# EasyEDA Pro project ProPrj_STM32_无人机_2026-08-31.epro, schematic 遥控

## Sheets
1 MCU: Assembly Variant: Basic; Board Name: Board1; Create Date: 2026-08-23; Page Name: P1; Project Name: STM32_无人机; Schematic Name: Schematic1; Update Date: 2026-08-23; Company: 嘉立创EDA; Page Size: A4; Version: V1.0
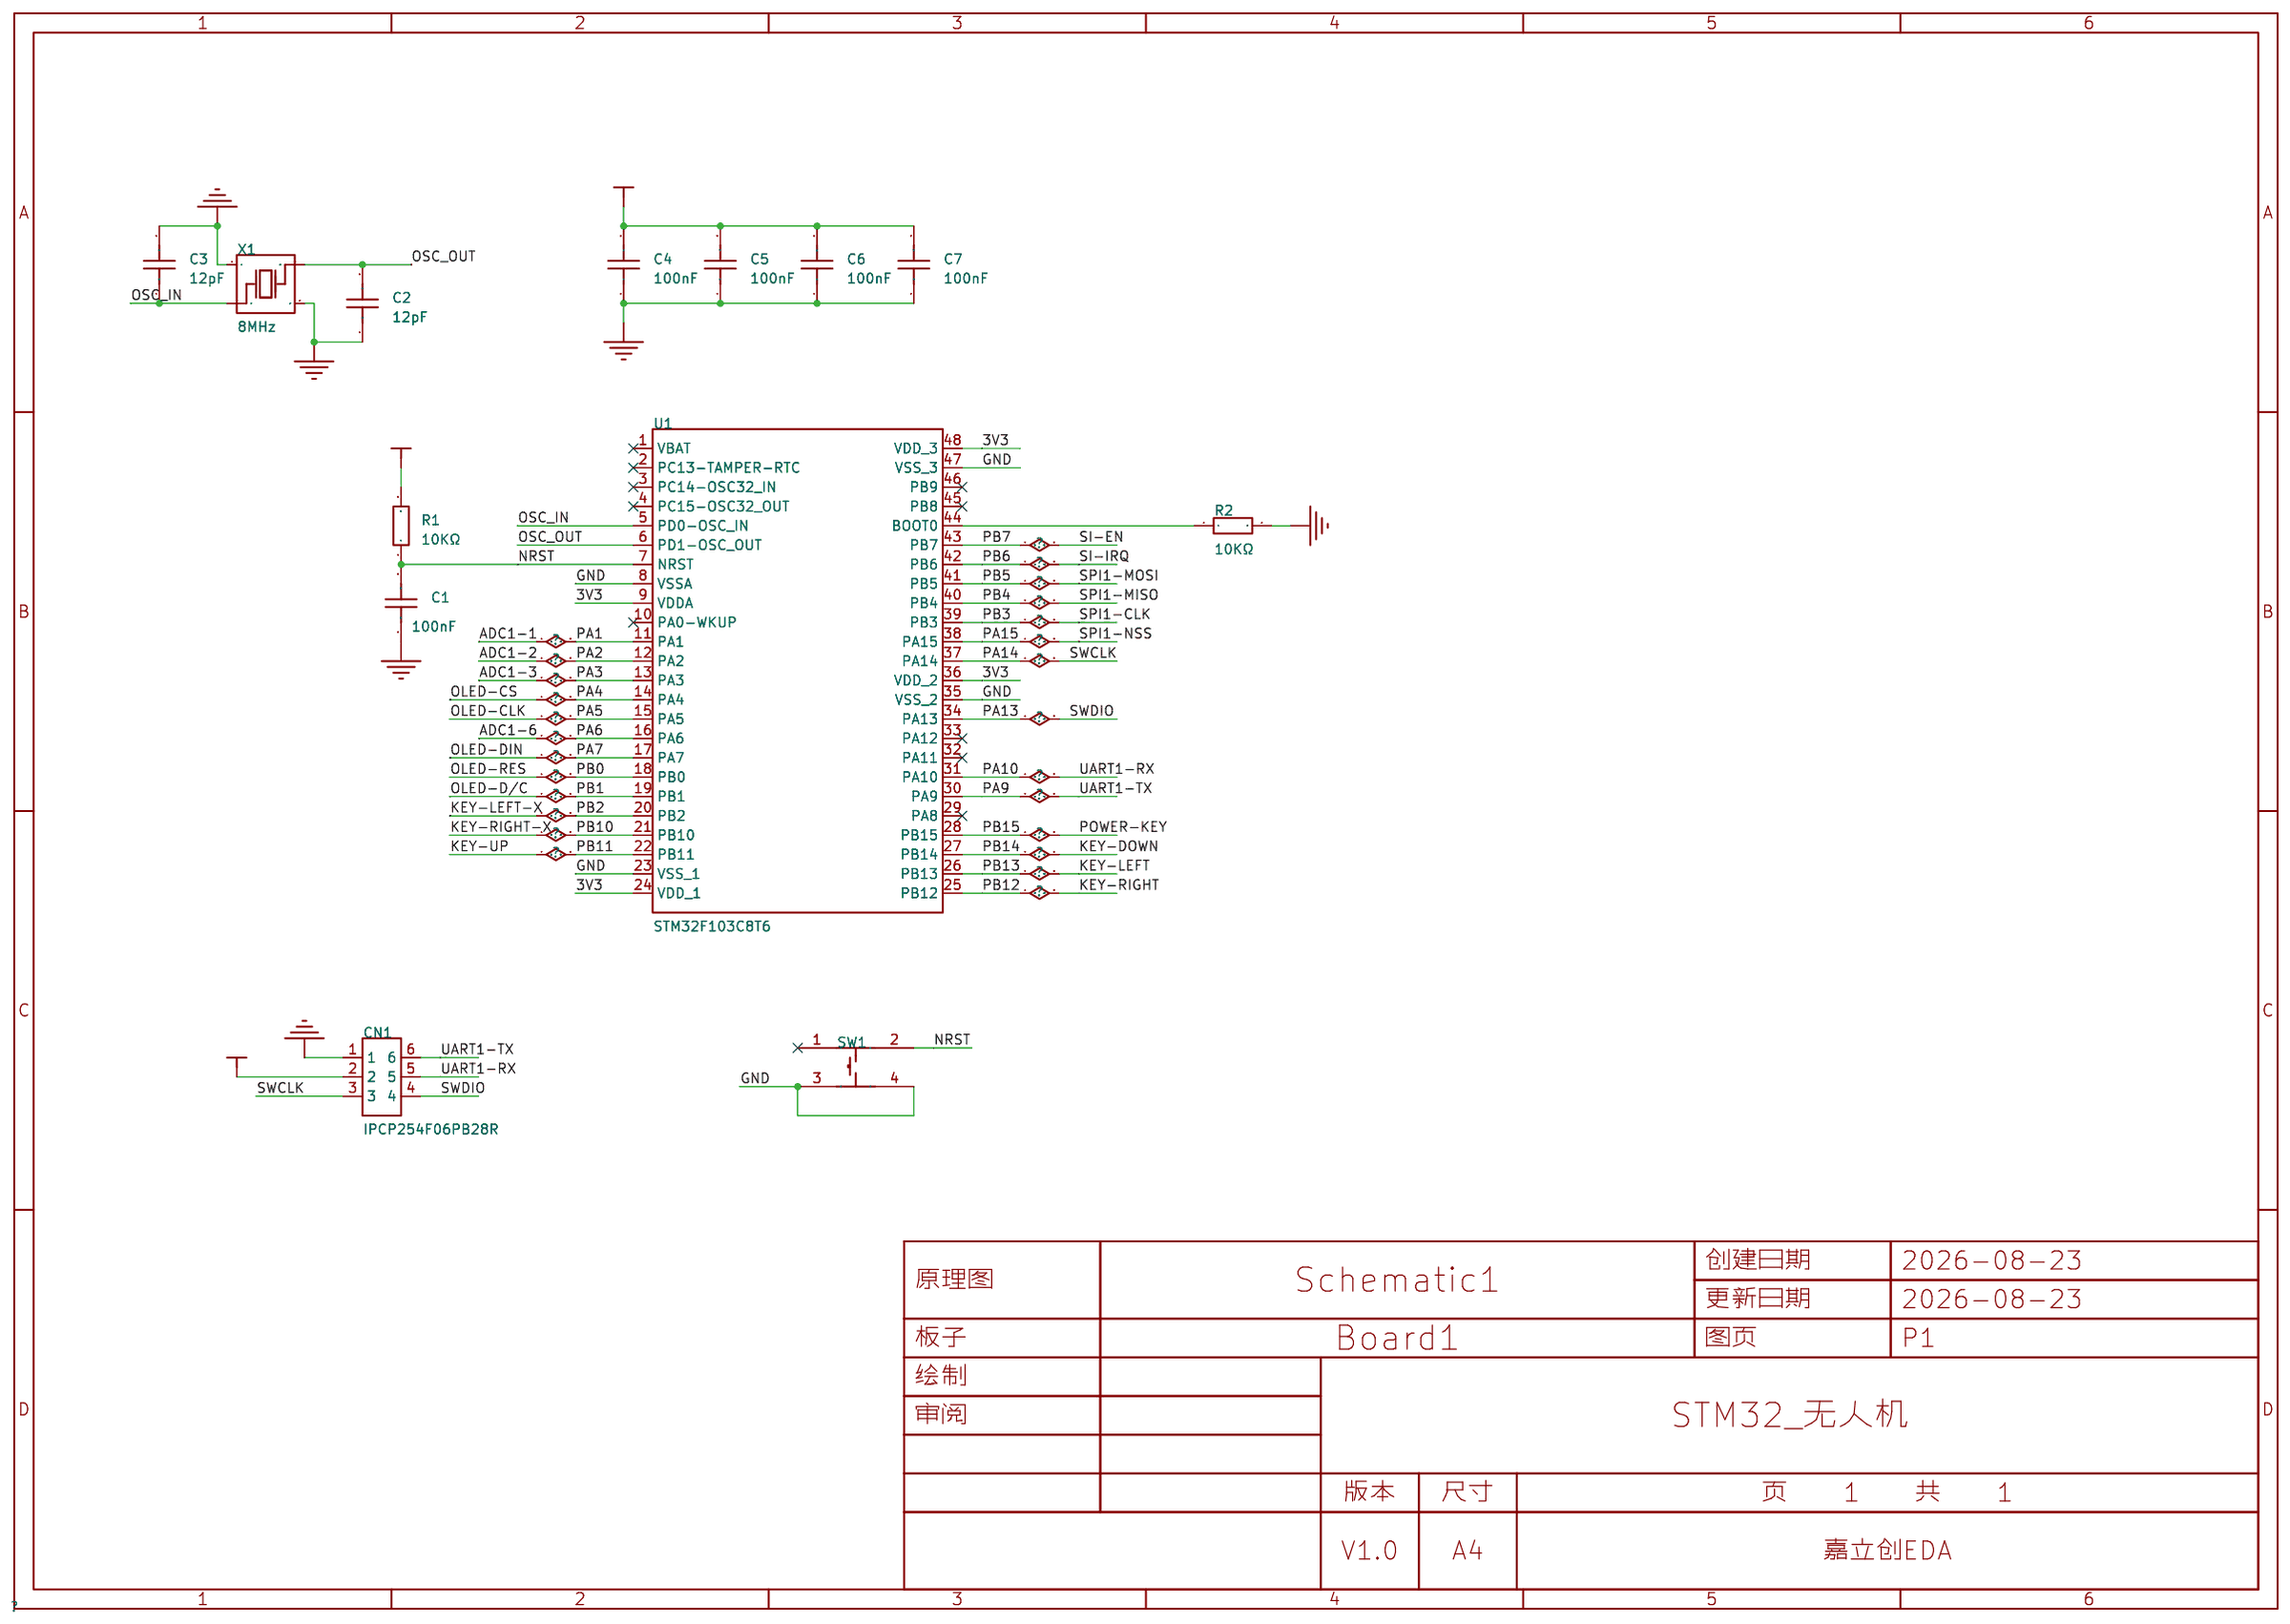
[diagram p0: MCU]
2 SI24R1: Board Name: 遥控器; Schematic Name: 遥控
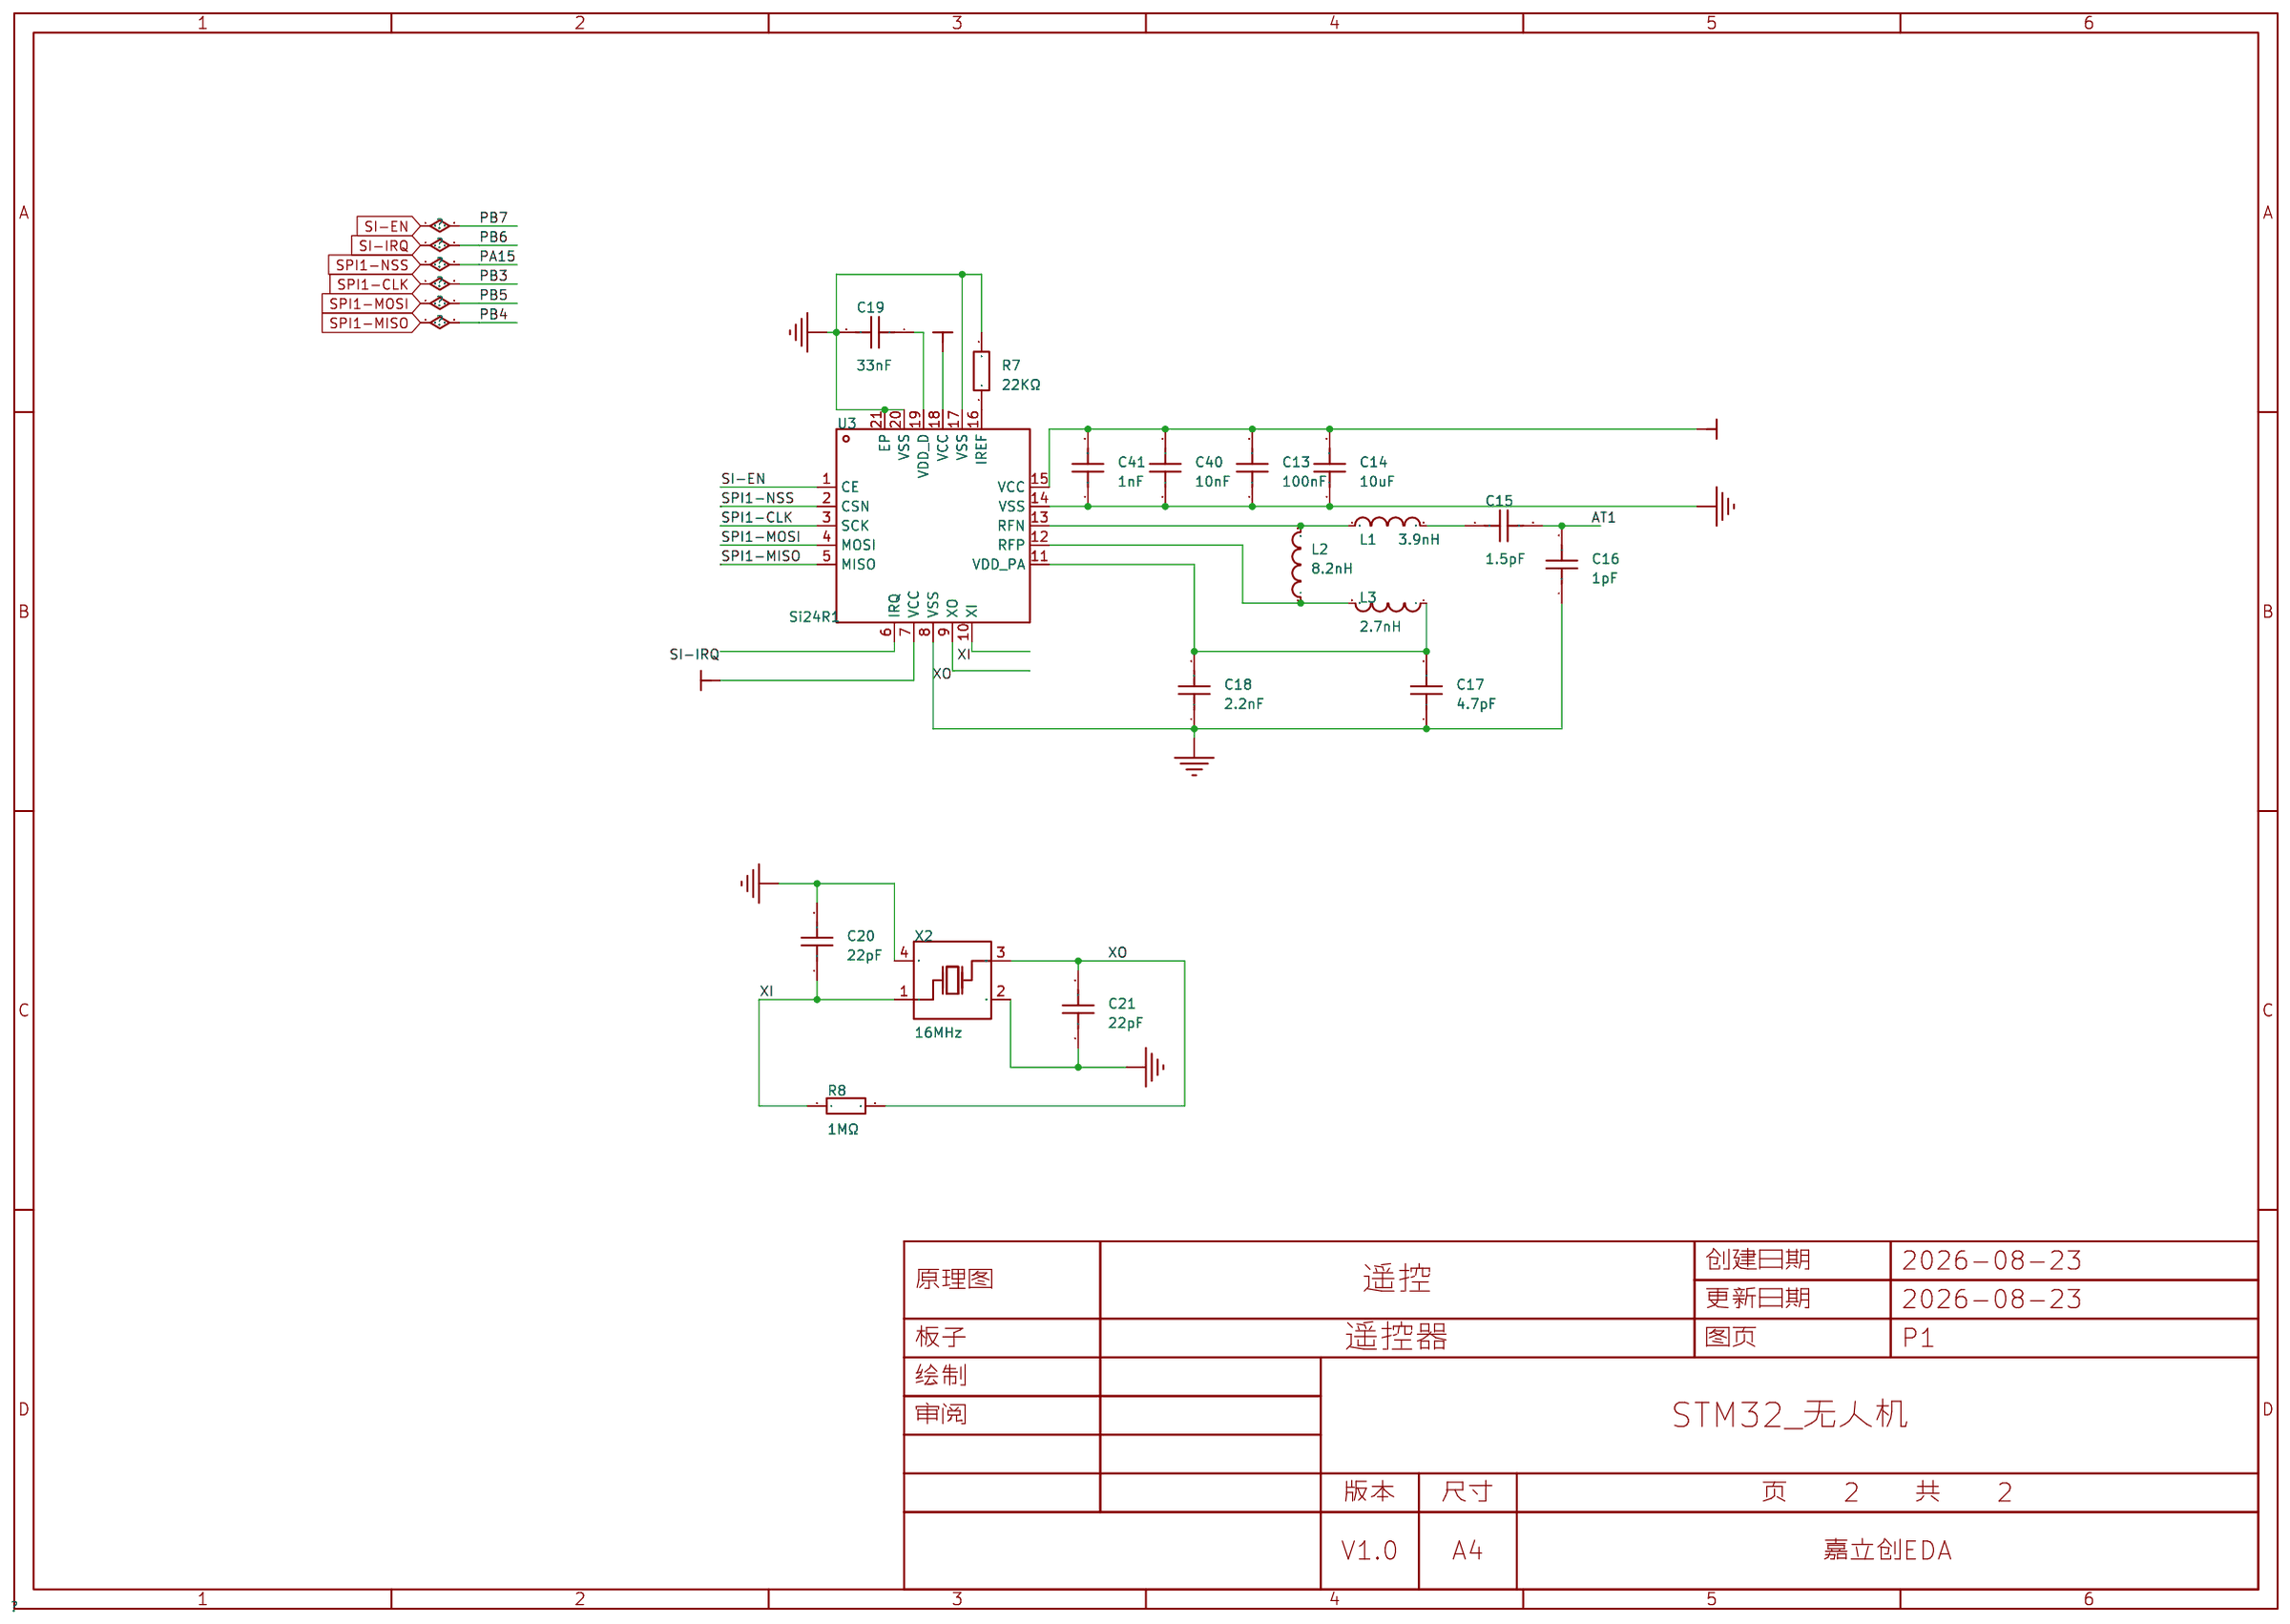
[diagram p1: SI24R1]
3 电源管理: Board Name: 遥控器; Schematic Name: 遥控
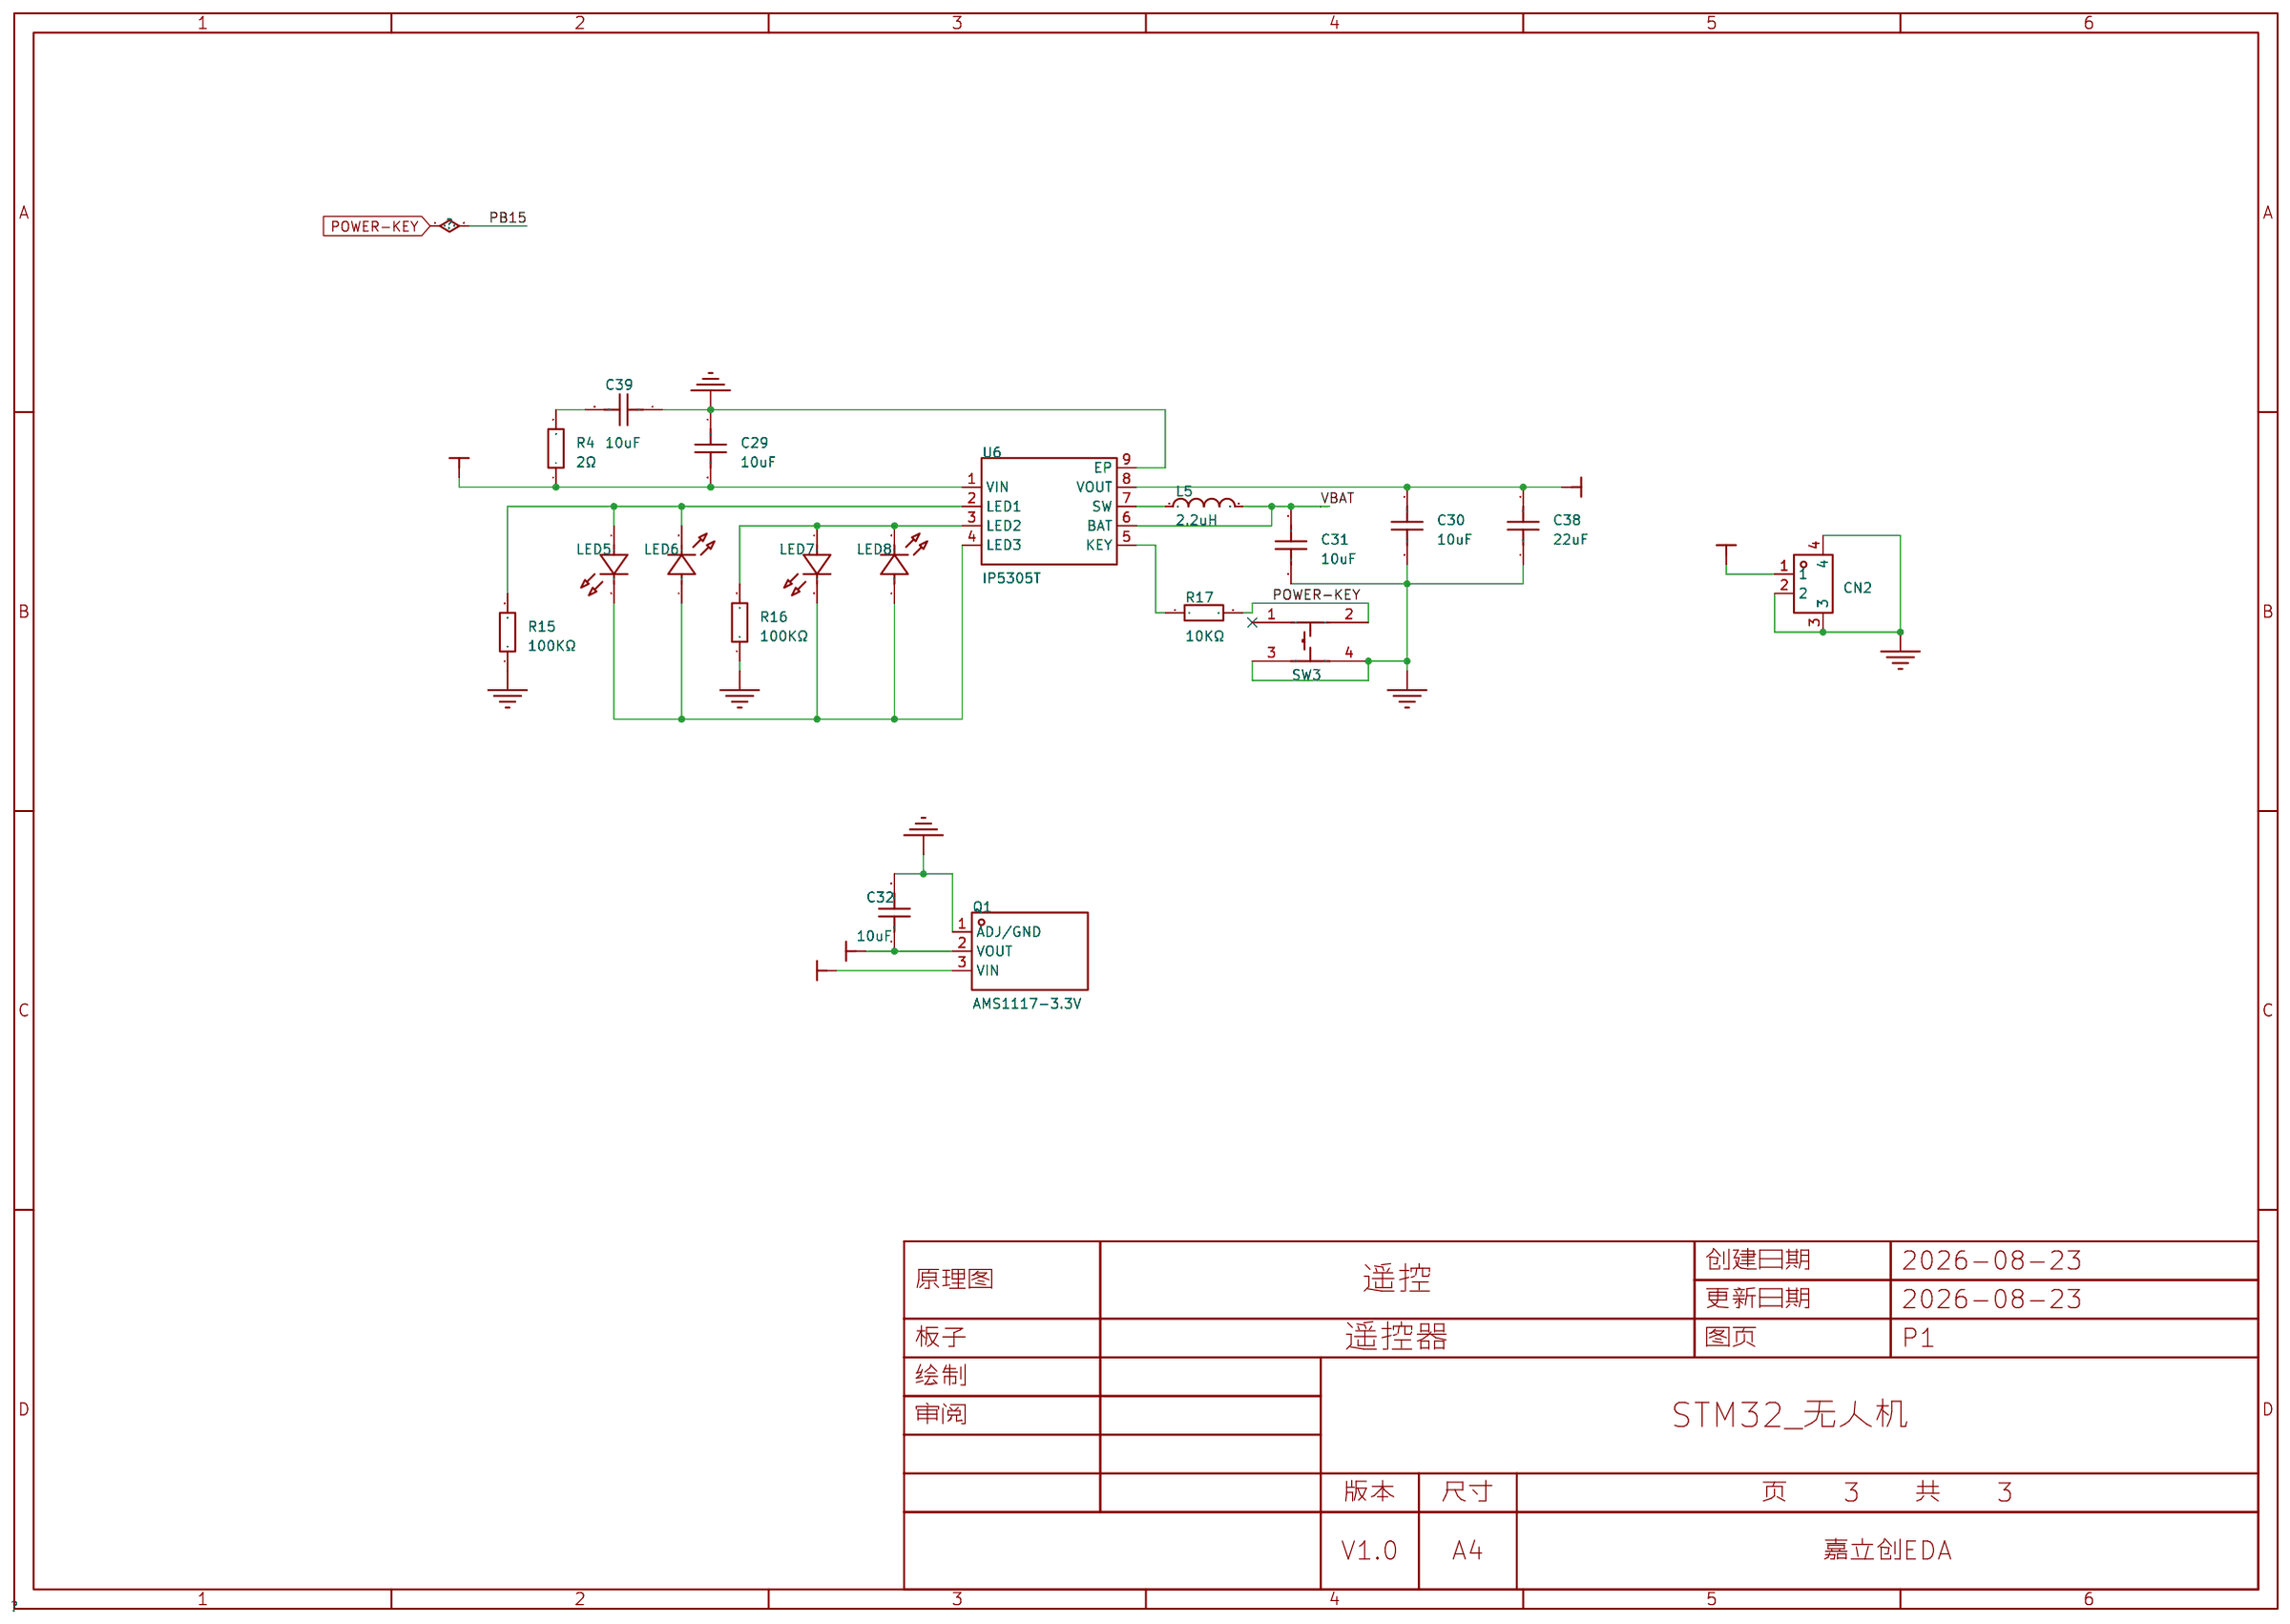
[diagram p2: 电源管理]
4 OLED: Board Name: 遥控器; Schematic Name: 遥控
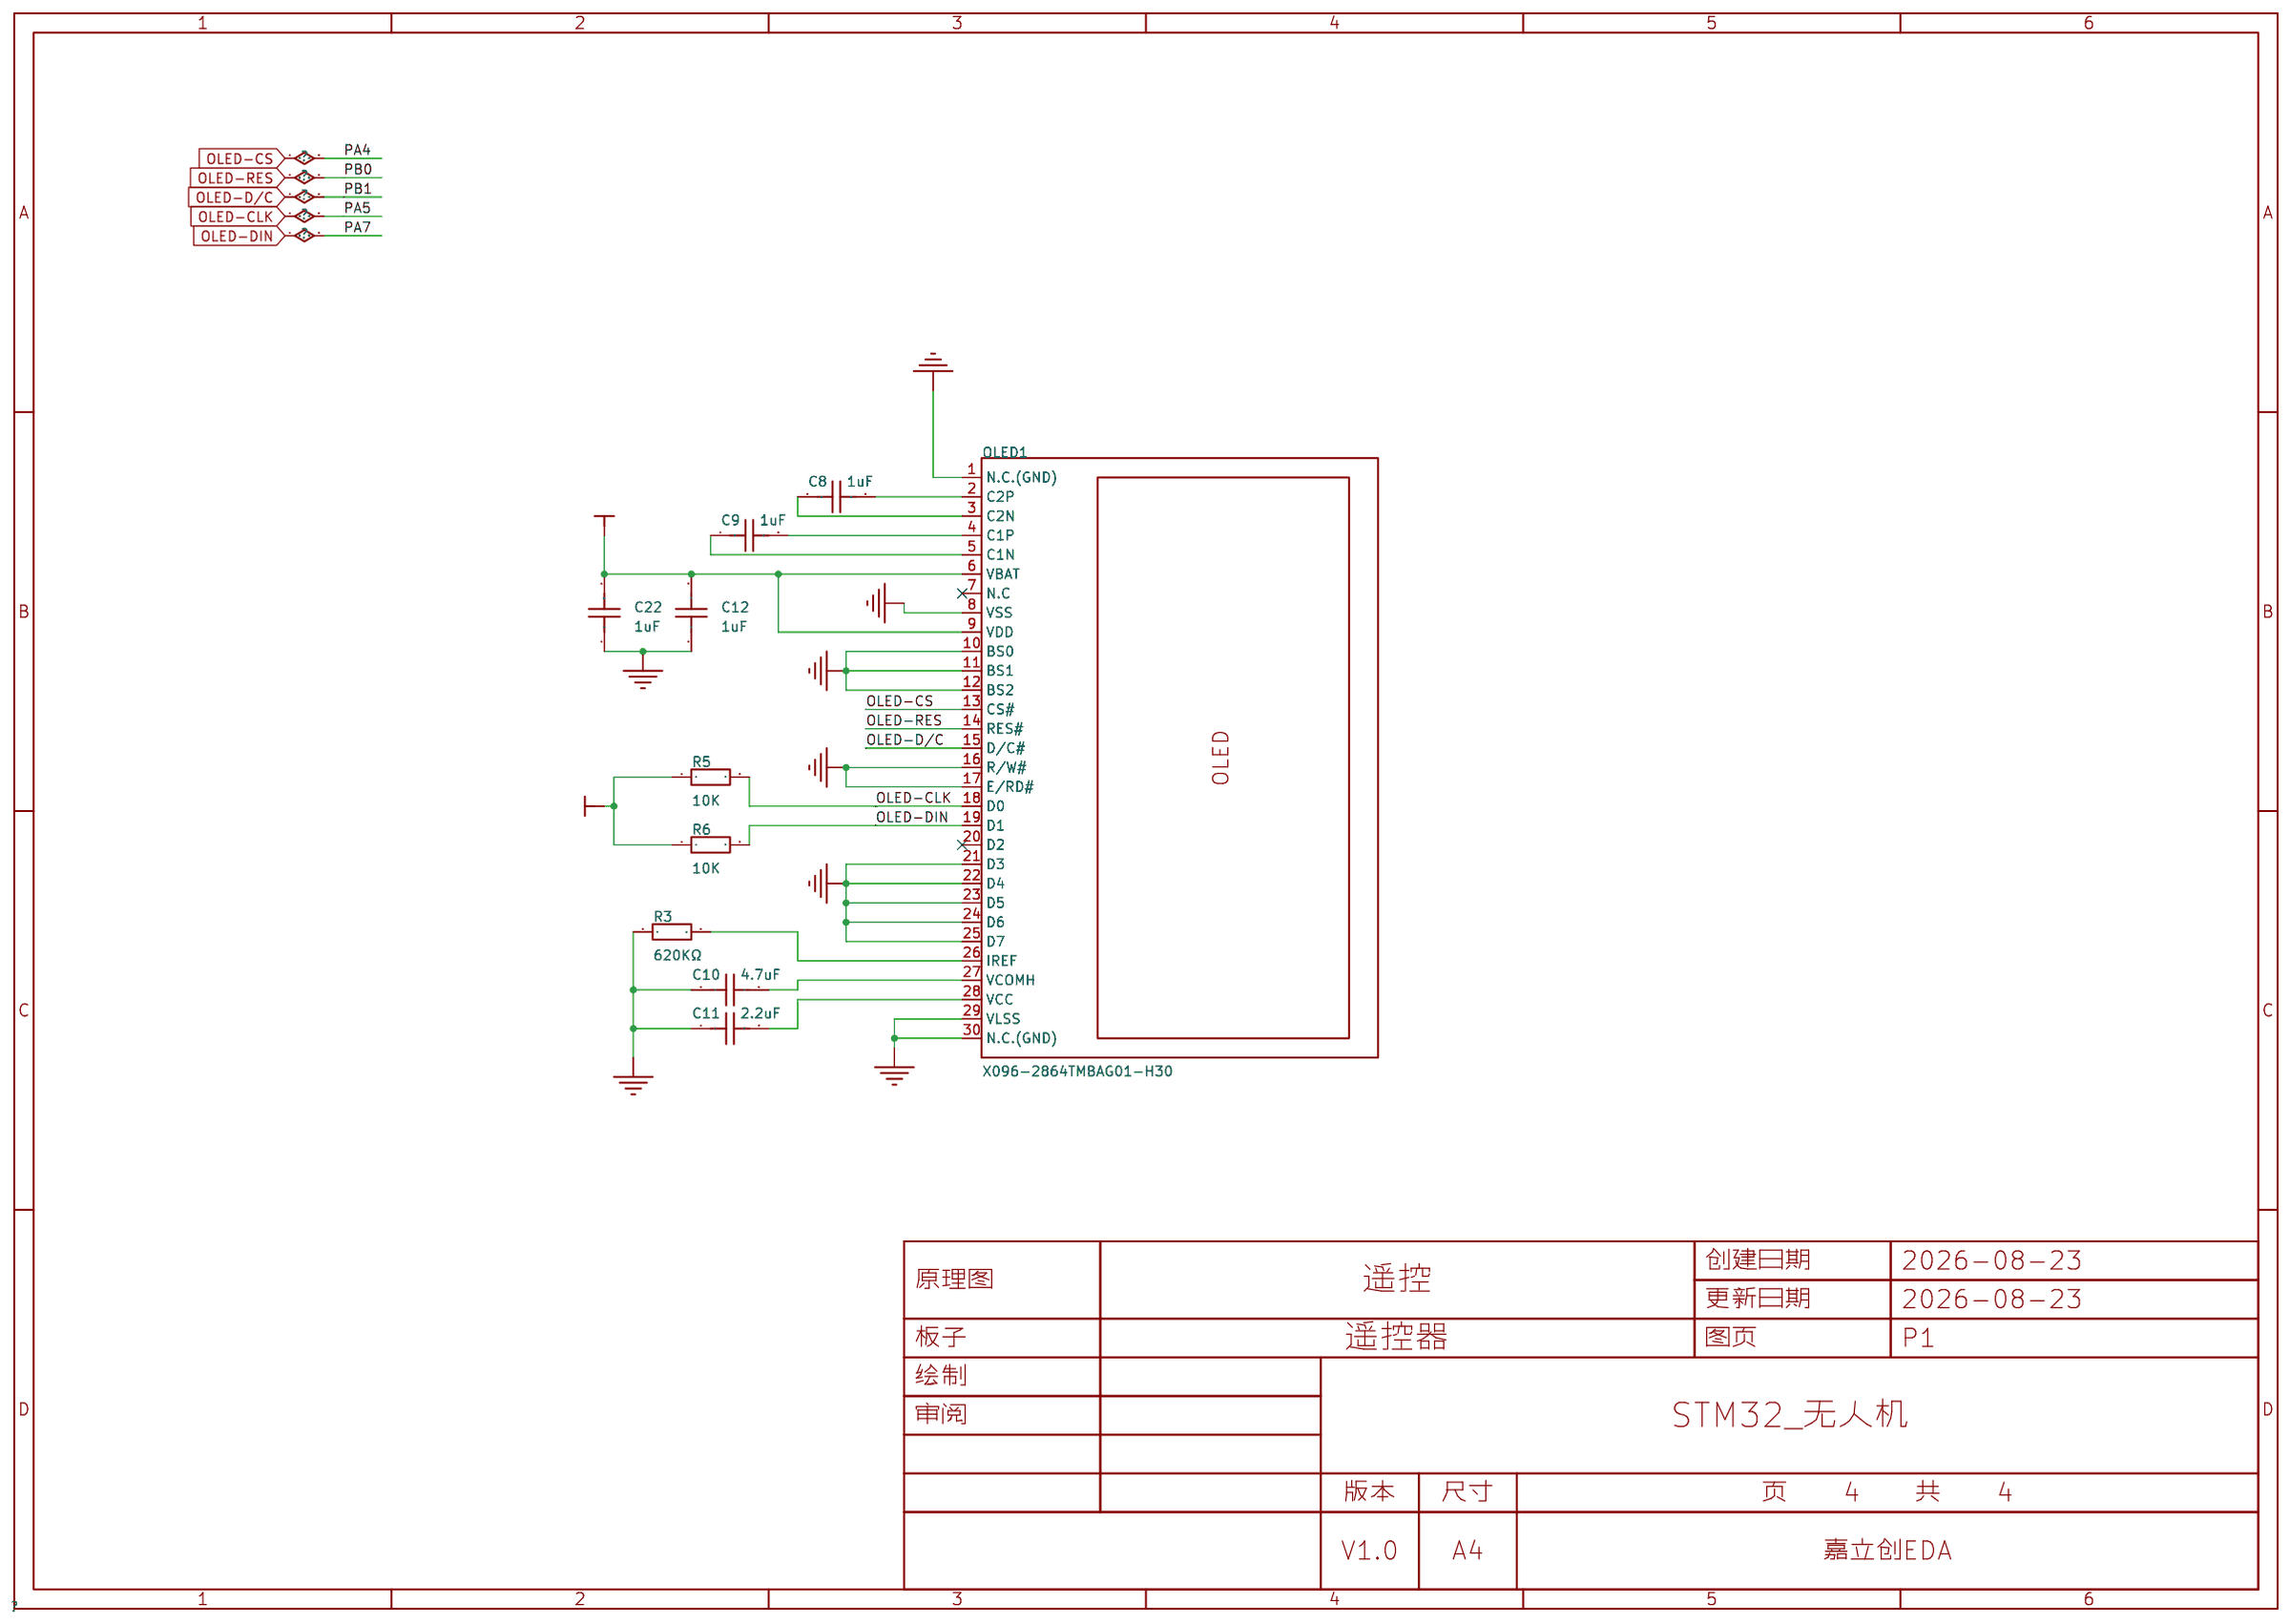
[diagram p3: OLED]
5 遥感和按键: Board Name: 遥控器; Create Date: 2026-08-24; Schematic Name: 遥控; Update Date: 2026-08-24
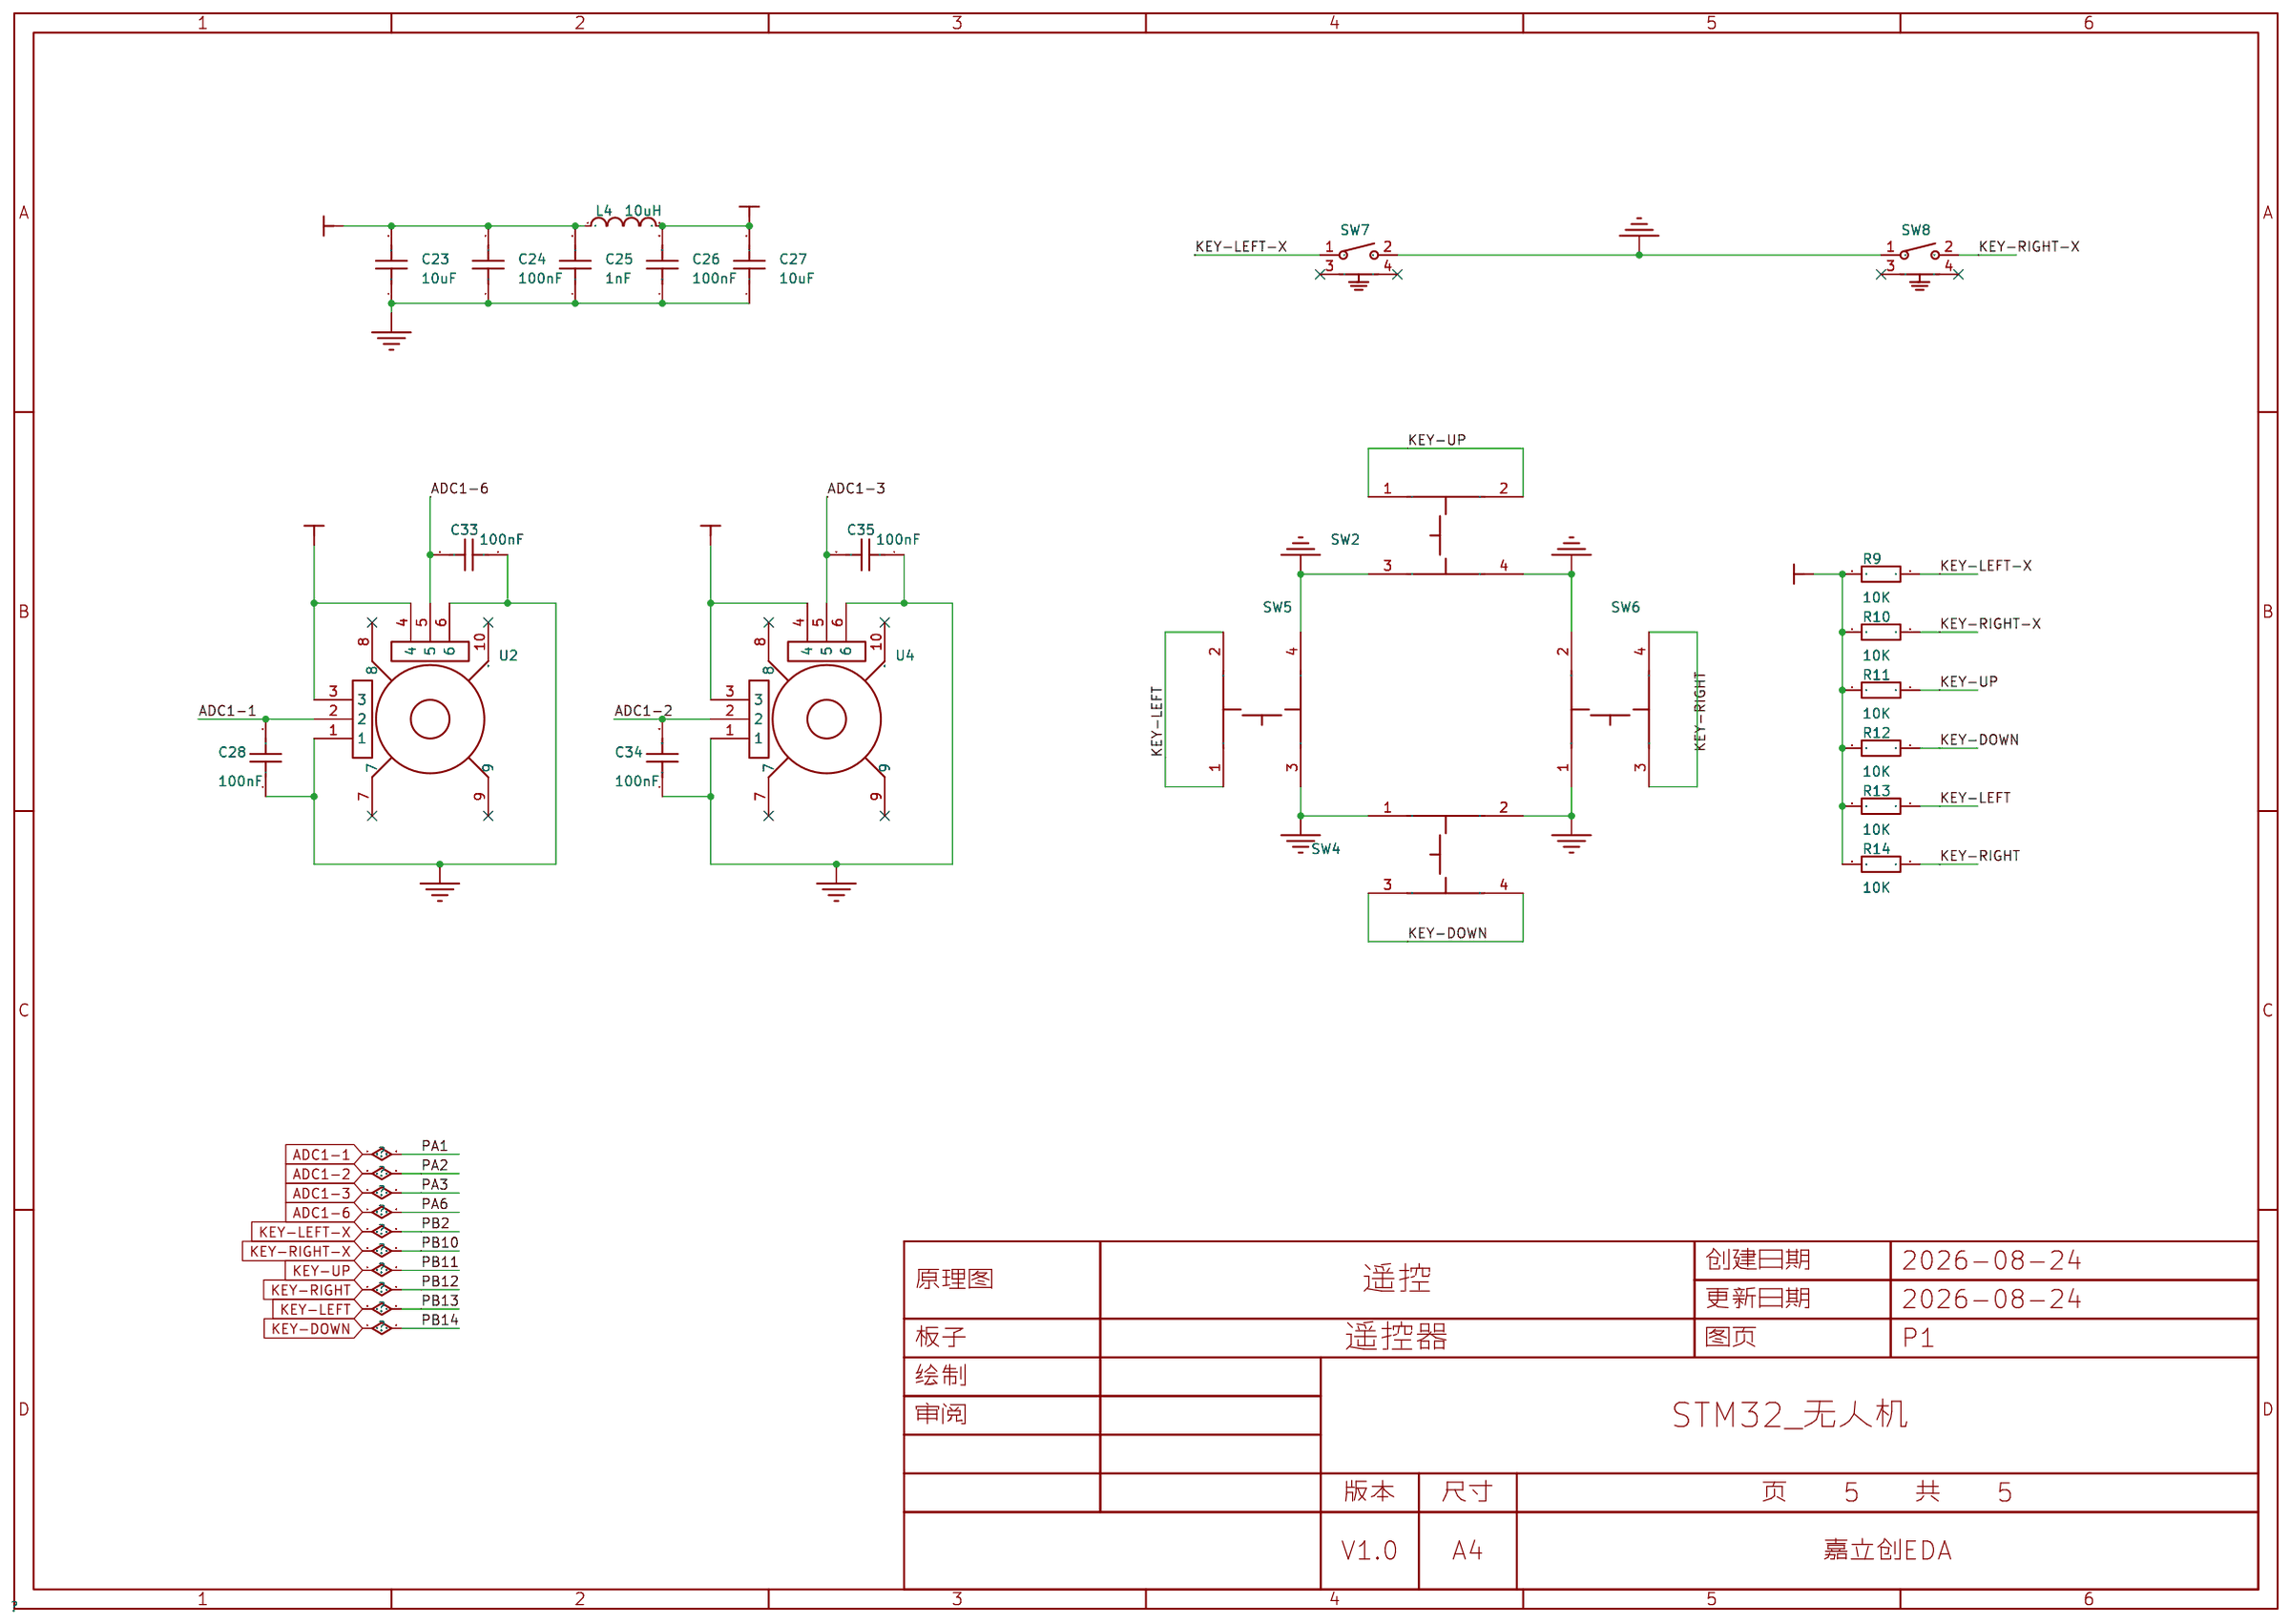
[diagram p4: 遥感和按键]

## Parts
sheet MCU
C1  100nF  [C0603]
C2  12pF  [C0603]
C3  12pF  [C0603]
C4  100nF  [C0603]
C5  100nF  [C0603]
C6  100nF  [C0603]
C7  100nF  [C0603]
CN1  IPCP254F06PB28R  [HDR-TH_6P-P2.54-H-F-R2-C3-S2.54-1]
R1  10KΩ  [R0603]
R2  10KΩ  [R0603]
SW1  SKRPACE010  [KEY-SMD_4P-L4.2-W3.2-P2.20-LS4.6]
U1  STM32F103C8T6  [LQFP-48_L7.0-W7.0-P0.50-LS9.0-BL]
X1  8MHz  [CRYSTAL-SMD_4P-L3.2-W2.5-BL]
sheet OLED
C8  1uF  [C0603]
C9  1uF  [C0603]
C10  4.7uF  [C0603]
C11  2.2uF  [C0603]
C12  1uF  [C0603]
C22  1uF  [C0603]
OLED1  X096-2864TMBAG01-H30  [OLED-SMD_X096-2864TMBAG01-H30]
R3  620KΩ  [R0603]
R5  10K  [R0603]
R6  10K  [R0603]
sheet SI24R1
C13  100nF  [C0603]
C14  10uF  [C0603]
C15  1.5pF  [C0603]
C16  1pF  [C0603]
C17  4.7pF  [C0603]
C18  2.2nF  [C0603]
C19  33nF  [C0603]
C20  22pF  [C0603]
C21  22pF  [C0603]
C40  10nF  [C0603]
C41  1nF  [C0603]
L1  3.9nH  [L0603]
L2  8.2nH  [L0603]
L3  2.7nH  [L0603]
R7  22KΩ  [R0603]
R8  1MΩ  [R0603]
U3  Si24R1  [QFN-20_L4.0-W4.0-P0.50-BL-EP]
X2  16MHz  [CRYSTAL-SMD_4P-L2.5-W2.0-BL-2]
sheet 电源管理
C29  10uF  [C0603]
C30  10uF  [C0603]
C31  10uF  [C0603]
C32  10uF  [C0603]
C38  22uF  [C0603]
C39  10uF  [C0603]
CN2  ZX-XH2.54-2PWT  [CONN-SMD_2P-P2.54_MEGASTAR_ZX-XH2.54-2PWT]
L5  2.2uH  [IND-SMD_L2.5-W2.0_MHCHL2520]
LED5  XL-1005UYC  [LED0402-FD_YELLOW]
LED6  XL-1005UYC  [LED0402-FD_YELLOW]
LED7  XL-1005UYC  [LED0402-FD_YELLOW]
LED8  XL-1005UYC  [LED0402-FD_YELLOW]
Q1  AMS1117-3.3V  [SOT-89-3_L4.5-W2.5-P1.50-LS4.2-BR]
R4  2Ω  [R0603]
R15  100KΩ  [R0603]
R16  100KΩ  [R0603]
R17  10KΩ  [R0603]
SW3  SKRPACE010  [KEY-SMD_4P-L4.2-W3.2-P2.20-LS4.6]
U6  IP5305T  [ESOP-8_L4.9-W3.9-P1.27-LS6.0-BL-EP]
sheet 遥感和按键
C23  10uF  [C0603]
C24  100nF  [C0603]
C25  1nF  [C0603]
C26  100nF  [C0603]
C27  10uF  [C0603]
C28  100nF  [C0603]
C33  100nF  [C0603]
C34  100nF  [C0603]
C35  100nF  [C0603]
L4  10uH  [L0603]
R9  10K  [R0603]
R10  10K  [R0603]
R11  10K  [R0603]
R12  10K  [R0603]
R13  10K  [R0603]
R14  10K  [R0603]
SW2  TS-1102S-C-M-B  [KEY-SMD_4P-L6.0-W6.0-P4.50-LS8.6_TS-1102S-C-M-B]
SW4  TS-1102S-C-M-B  [KEY-SMD_4P-L6.0-W6.0-P4.50-LS8.6_TS-1102S-C-M-B]
SW5  TS-1102S-C-M-B  [KEY-SMD_4P-L6.0-W6.0-P4.50-LS8.6_TS-1102S-C-M-B]
SW6  TS-1102S-C-M-B  [KEY-SMD_4P-L6.0-W6.0-P4.50-LS8.6_TS-1102S-C-M-B]
SW7  UK-B02124G90-AQ25Y  [SW-TH_UK-B02124G90-AQ25Y]
SW8  UK-B02124G90-AQ25Y  [SW-TH_UK-B02124G90-AQ25Y]
U2  -  [油门摇杆16*16]
U4  -  [油门摇杆16*16]

## Library data of the parts
C1-C35 C38-C41 = CAP_0603: Supplier Footprint: 0603
CN1 = IPCP254F06PB28R: 插孔结构:2x3P;间距:2.54mm;圆孔/方孔:方孔;安装方式:弯插;排数:双排;总孔位数:6P;额定电流:3A;额定电压:-;塑高:5mm;触头材质:黄铜;触头镀层:金;工作温度:-40℃~+105℃;; LCSC Part Name: 2x3P 间距:2.54mm 弯插; Supplier Part: C22438452; Manufacturer: INCP; Supplier Footprint: 弯插,P=2.54mm; JLCPCB Part Class: Extended Part; Datasheet: https://item.szlcsc.com/datasheet/IPCP254F06PB28R/24076641.html; Supplier: LCSC; Holes Structure: 2x3P; Pitch: 2.54mm; Circular Hole / Square Hole: 方孔; Mounting Type: 弯插; Number of Rows: 双排; Number of Positions: 6P; Current Rating: 3A; Insulation Height: 5mm; Contact Material: 黄铜; Contact Plating: 金; Operating Temperature: -40℃~+105℃
R1-R17 = Res_0603: Supplier Footprint: 0603
SW1 SW3 = SKRPACE010: 电路结构:单刀单掷;按钮形状:椭圆形按钮;安装方式:立贴;开关长度:4.2mm;开关宽度:3.2mm;开关高度:2.5mm;触点电流:50mA;额定电压:16V;带灯:-;工作寿命:-;; LCSC Part Name: 4.2*3.2*2.5mm 立贴 轻触开关; Supplier Part: C139797; Manufacturer: ALPSALPINE(阿尔卑斯阿尔派); Supplier Footprint: SMD-4P,4.2x3.2mm; JLCPCB Part Class: Extended Part; Datasheet: https://item.szlcsc.com/datasheet/SKRPACE010/151122.html; Supplier: LCSC; Circuit: 单刀单掷; Actuator Style: 椭圆形按钮; Mounting Type: 立贴; Length: 4.2mm; Width: 3.2mm; Switch Height: 2.5mm; Contact Current: 50mA; Voltage Rating: 16V
U1 = STM32F103C8T6: CPU内核:ARM Cortex-M3;CPU最大主频:72MHz;CPU位数:32 Bit;; LCSC Part Name: 主流增强型ARM Cortex-M3 MCU，具有64 KB Flash、72 MHz CPU、电机控制、USB和CAN; Supplier Part: C8734; Manufacturer: ST(意法半导体); Supplier Footprint: LQFP-48(7x7); JLCPCB Part Class: Extended Part; Datasheet: https://item.szlcsc.com/datasheet/STM32F103C8T6/9243.html; Supplier: LCSC; CPU Core: ARM Cortex-M3; CPU Maximum Speed: 72MHz; Core Size: 32 Bit; Program Storage Size: 64KB; Program Memory Type: FLASH; RAM Size: 20KB; Number of I/O: 37; ADC (Bit): 12bit; Oscillator Type: 内置; Voltage - Supply: 2V~3.6V; Operating Temperature: -40℃~+85℃
X1 = TAXM8M4RDBCCT2T: 晶振类型:贴片晶振;频率:8MHz;常温频差:±10ppm;负载电容:10pF;频率稳定度:±15ppm;; LCSC Part Name: 8MHz ±10ppm 10pF; Supplier Part: C400090; Manufacturer: YJX(雅晶鑫); Supplier Footprint: SMD3225-4P; JLCPCB Part Class: Extended Part; Datasheet: https://item.szlcsc.com/datasheet/TAXM8M4RDBCCT2T/383475.html; Supplier: LCSC; Type: 贴片晶振; Normal temperature Frequency Tolerance: ±10ppm; Load Capacitance: 10pF; Frequency Stability: ±15ppm; Equivalent Series Resistance(ESR): 250Ω; Operating Temperature: -40℃~+85℃
OLED1 = X096-2864TMBAG01-H30: 核心芯片:SSD1315;尺寸(inch):0.96;像素分辨率:128x64;; LCSC Part Name: 0.96寸 双色 128x64像素分辨率 30PIN; Supplier Part: C5123564; Manufacturer: Wisevision(新智景); JLCPCB Part Class: Extended Part; Datasheet: https://item.szlcsc.com/datasheet/X096-2864TMBAG01-H30/5717757.html; Supplier: LCSC; Controller Type: SSD1315; Size: 0.96; Dot Pixels: 128x64
L1-L4 = L_0603
U3 = Si24R1: 频率范围:2.4GHz~2.525GHz;接口类型:SPI;应用领域:ISM;数据速率:2Mbps;灵敏度:-96dBm;典型应用频率:2.4GHz;; LCSC Part Name: 超低功耗、高性能2.4 GHz GFSK收发器; Supplier Part: C14436; Manufacturer: 南京中科微; Supplier Footprint: QFN-20-EP(4x4); JLCPCB Part Class: Extended Part; Datasheet: https://item.szlcsc.com/datasheet/Si24R1/15098.html; Supplier: LCSC; Frequency Range: 2.4GHz~2.525GHz; Interface: SPI; Voltage - Supply: 1.9V~3.6V; Applications: ISM; Output Power: 7dBm; Data Rate: 2Mbps; Current Of Transmitting: 12mA; Sensitivity: -96dBm; Receive Current: 15mA; Typical Application Frequency: 2.4GHz; Operating Temperature: -40℃~+85℃; Type: 收发器; Features: CRC校验功能；支持RSSI功能；自动重传功能；自动应答功能
X2 = SX25Y016000B91T: 晶振类型:贴片晶振;频率:16MHz;常温频差:±10ppm;负载电容:9pF;频率稳定度:±10ppm;; LCSC Part Name: 2520 16M 9PF  10ppm  -20 -75℃; Supplier Part: C271644; Manufacturer: TKD(泰晶); Supplier Footprint: SMD2520-4P; JLCPCB Part Class: Extended Part; Datasheet: https://item.szlcsc.com/datasheet/SX25Y016000B91T/260707.html; Supplier: LCSC; Type: 贴片晶振; Normal temperature Frequency Tolerance: ±10ppm; Load Capacitance: 9pF; Frequency Stability: ±10ppm; Equivalent Series Resistance(ESR): 80Ω
CN2 = ZX-XH2.54-2PWT: 插针结构:1x2P;间距:2.5mm;安装方式:卧贴;参考系列:XH;总PIN数:2P;排数:1;每排PIN数:2;行距:-;额定电流:3A;触头材质:黄铜;触头镀层:锡;工作温度:-25℃~+85℃;; LCSC Part Name: 1x2P 间距:2.5mm 卧贴 系列:XH; Supplier Part: C7429671; Manufacturer: Megastar(兆星); Supplier Footprint: SMD,P=2.5mm,卧贴; JLCPCB Part Class: Extended Part; Datasheet: https://item.szlcsc.com/datasheet/ZX-XH2.54-2PWT/8427588.html; Supplier: LCSC; Pins Structure: 1x2P; Pitch: 2.5mm; Mounting Type: 卧贴; Reference Series: XH; Number of Pins: 2P; Number of Rows: 1; Number of PINs Per Row: 2; Current Rating: 3A; Contact Material: 黄铜; Contact Plating: 锡; Operating Temperature: -25℃~+85℃; Voltage Rating: 250V; Plastic Material: LCP; Supplementary Features: 辅助焊脚; Color: 米色; Z-Height of the Board: 6.2mm; X-Length of Bottom Edge on Board (Spacing Line): 10mm; Y-Width of Bottom Edge on Board: 7.8mm
L5 = FTC252012S2R2MBCA: 电感值:2.2uH;精度:±20%;额定电流:3A;饱和电流(Isat):3.8A;类型:-;; LCSC Part Name: 2.2uH ±20% 3.8A; Supplier Part: C5832372; Manufacturer: cjiang(长江微电); Supplier Footprint: 1008; JLCPCB Part Class: Extended Part; Datasheet: https://item.szlcsc.com/datasheet/FTC252012S2R2MBCA/6763492.html; Supplier: LCSC; Tolerance: ±20%; Current Rating: 3A; Current - Saturation(Isat): 3.8A; DC Resistance(DCR): 55mΩ
LED5-LED8 = XL-1005UYC_C25503856: 灯头类型:1.0mmx0.5mm方形灯头;发光颜色:黄色;正向压降(Vf):2.4V;功率:50mW;正向电流:20mA;波长:585nm~595nm;二极管配置:独立二极管;透镜颜色:无色透明透镜;色温:-;发光强度:210mcd;发光角度:120°;载带方式:-;工作温度:-40℃~+85℃;; LCSC Part Name: 0402黄光贴片式发光二极管; Supplier Part: C25503856; Manufacturer: XINGLIGHT(成兴光); Supplier Footprint: 0402; JLCPCB Part Class: Extended Part; Datasheet: https://item.szlcsc.com/datasheet/XL-1005UYC/27234970.html; Supplier: LCSC; Lamp Holder Type: 1.0mmx0.5mm方形灯头; Illumination Color: 黄色; Voltage - Forward(Vf): 2.4V; Power(Watts): 50mW; Forward Current: 20mA; Wavelength - Dominant: 585nm~595nm; Peak Wavelength: 590nm; Diode Configuration: 独立二极管; Lens Color: 无色透明透镜; Luminous Intensity: 210mcd; Viewing Angle: 120°; Operating Temperature: -40℃~+85℃
Q1 = AMS1117-3.3V_C5120796: 输出极性:正极;工作电压:15V;输出电压:3.3V;输出电流:1A;电源纹波抑制比(PSRR):-;输出类型:固定;; LCSC Part Name: 3.3V 1A 15V; Supplier Part: C5120796; Manufacturer: MSKSEMI(美森科); Supplier Footprint: SOT-89; JLCPCB Part Class: Extended Part; Datasheet: https://item.szlcsc.com/datasheet/AMS1117-3.3V/5706251.html; Supplier: LCSC; Output Configuration: 正极; Voltage - Supply: 15V; Output Voltage: 3.3V; Output Current: 1A; standby current: 12mA; Operating Temperature: 0℃~+125℃@(Ta); Output Type: 固定; Number of Outputs: 1
U6 = IP5305T: 工作电压:4.65V~5.5V;最大充电电流:1.4A;电池类型:锂电池;电池节数:1;; LCSC Part Name: 1.2A充电 1.0A放电高集成度移动电源SOC; Supplier Part: C2982924; Manufacturer: INJOINIC(英集芯); Supplier Footprint: ESOP-8; JLCPCB Part Class: Extended Part; Datasheet: https://item.szlcsc.com/datasheet/IP5305T/3415531.html; Supplier: LCSC; The Chip Type: 充电芯片; Voltage - Supply: 4.65V~5.5V; Charge Current - Max: 1.4A; Charging Saturation Voltage: 4.2V; End-Off Voltage: 2.85V; Type of Battery: 锂电池; Number of Cells: 1; Operating Temperature: -20℃~+70℃; Battery Temperature Detection: 不支持; Supply Current (Iq): 100uA
SW2 SW4-SW6 = TS-1102S-C-M-B: 电路结构:单刀单掷;按钮形状:圆形按钮;作用力:2.6N;安装方式:立贴;开关长度:6mm;开关宽度:6mm;开关高度:10mm;带支架:不带支架;触点电流:50mA;额定电压:12V;带灯:无;工作寿命:30万次;; LCSC Part Name: 6*6*10mm 立贴 轻触开关; Supplier Part: C381050; Manufacturer: XKB Connection(中国星坤); Supplier Footprint: SMD-4P,6x6mm; JLCPCB Part Class: Extended Part; Datasheet: https://item.szlcsc.com/datasheet/TS-1102S-C-M-B/353282.html; Supplier: LCSC; Circuit: 单刀单掷; Actuator Style: 圆形按钮; Operating Force: 2.6N; Mounting Type: 立贴; Length: 6mm; Width: 6mm; Switch Height: 10mm; with Bracket: 不带支架; Contact Current: 50mA; Voltage Rating: 12V; Actuator/Cap Color: 黑色; With Lamp: 无; Life: 30万次; Operating Temperature: -20℃~+70℃
SW7 SW8 = UK-B02124G90-AQ25Y: 电路结构:单刀单掷;按钮形状:圆形按钮;作用力:2.5N;安装方式:弯插;开关长度:6mm;开关宽度:6mm;开关高度:9mm;带支架:带支架;触点电流:50mA;额定电压:12V;带灯:无;工作寿命:10万次;; LCSC Part Name: 6*6*9mm 卧插 轻触开关; Supplier Part: C493238; Manufacturer: USAKRO(美韩); Supplier Footprint: 弯插,6x6mm; JLCPCB Part Class: Extended Part; Datasheet: https://item.szlcsc.com/datasheet/UK-B02124G90-AQ25Y/503894.html; Supplier: LCSC; Circuit: 单刀单掷; Actuator Style: 圆形按钮; Operating Force: 2.5N; Mounting Type: 弯插; Length: 6mm; Width: 6mm; Switch Height: 9mm; with Bracket: 带支架; Contact Current: 50mA; Voltage Rating: 12V; Actuator/Cap Color: 黑色; With Lamp: 无; Termination Style: PC引脚; Life: 10万次; Operating Temperature: -20℃~+70℃
U2 U4 = 摇杆油门

## Nets
3V3: C4.2 C5.2 C6.2 C7.2 C12.2 C13.2 C14.2 C22.2 C26.2 C27.2 C32.1 C40.2 C41.2 L4.2 OLED1.6(VBAT) OLED1.9(VDD) Q1.2(VOUT) R1.2 R5.1 R6.1 U1.9(VDDA) U1.24(VDD_1) U1.36(VDD_2) U1.48(VDD_3) U3.7(VCC) U3.15(VCC) U3.18(VCC)
+5V: C30.1 C38.2 Q1.3(VIN) U6.8(VOUT)
GND: C1.1 C2.1 C3.2 C4.1 C5.1 C6.1 C7.1 C10.1 C11.1 C12.1 C13.1 C14.1 C16.1 C17.1 C18.1 C19.2 C20.2 C21.1 C22.1 C23.1 C24.1 C25.1 C26.1 C27.1 C28.1 C29.1 C30.2 C31.2 C32.2 C33.1 C34.1 C35.1 C38.1 C39.1 C40.1 C41.1 CN1.1 CN2.2 CN2.3 CN2.4 OLED1.1(N.C.(GND)) OLED1.8(VSS) OLED1.10(BS0) OLED1.11(BS1) OLED1.12(BS2) OLED1.16(R/W#) OLED1.17(E/RD#) OLED1.21(D3) OLED1.22(D4) OLED1.23(D5) OLED1.24(D6) OLED1.25(D7) OLED1.29(VLSS) OLED1.30(N.C.(GND)) Q1.1(ADJ/GND) R2.2 R3.1 R7.2 R15.1 R16.1 SW1.3 SW1.4 SW2.3 SW2.4 SW3.3 SW3.4 SW4.1 SW4.2 SW5.3 SW5.4 SW6.1 SW6.2 SW7.2 SW8.1 U1.8(VSSA) U1.23(VSS_1) U1.35(VSS_2) U1.47(VSS_3) U2.1 U2.6 U3.8(VSS) U3.14(VSS) U3.17(VSS) U3.20(VSS) U3.21(EP) U4.1 U4.6 U6.9(EP) X1.2 X1.4 X2.2(GND) X2.4(GND)
S3V3: C23.2 C24.2 C25.2 L4.1 R9.2 R10.2 R11.2 R12.2 R13.2 R14.2 U2.3 U2.4 U4.3 U4.4
VBAT: C31.1 CN2.1 L5.2 U6.6(BAT)
VCC: C29.2 CN1.2 R4.1 U6.1(VIN)
ADC1-1: C28.2 U1.11(PA1) U2.2
ADC1-2: C34.2 U1.12(PA2) U4.2
ADC1-3: C35.2 U1.13(PA3) U4.5
ADC1-6: C33.2 U1.16(PA6) U2.5
AT1: C15.2 C16.2
KEY-DOWN: R12.1 SW4.3 SW4.4 U1.27(PB14)
KEY-LEFT: R13.1 SW5.1 SW5.2 U1.26(PB13)
KEY-LEFT-X: R9.1 SW7.1 U1.20(PB2)
KEY-RIGHT: R14.1 SW6.3 SW6.4 U1.25(PB12)
KEY-RIGHT-X: R10.1 SW8.2 U1.21(PB10)
KEY-UP: R11.1 SW2.1 SW2.2 U1.22(PB11)
NRST: C1.2 R1.1 SW1.2 U1.7(NRST)
OLED-CLK: OLED1.18(D0) R5.2 U1.15(PA5)
OLED-CS: OLED1.13(CS#) U1.14(PA4)
OLED-D/C: OLED1.15(D/C#) U1.19(PB1)
OLED-DIN: OLED1.19(D1) R6.2 U1.17(PA7)
OLED-RES: OLED1.14(RES#) U1.18(PB0)
OSC_IN: C3.1 U1.5(PD0-OSC_IN) X1.1
OSC_OUT: C2.2 U1.6(PD1-OSC_OUT) X1.3
PA9: CN1.6 U1.30(PA9)
PA10: CN1.5 U1.31(PA10)
PA13: CN1.4 U1.34(PA13)
PA14: CN1.3 U1.37(PA14)
PA15: U1.38(PA15) U3.2(CSN)
PB3: U1.39(PB3) U3.3(SCK)
PB4: U1.40(PB4) U3.5(MISO)
PB5: U1.41(PB5) U3.4(MOSI)
PB6: U1.42(PB6) U3.6(IRQ)
PB7: U1.43(PB7) U3.1(CE)
PB15: R17.2 SW3.2 U1.28(PB15)
XI: C20.1 R8.1 U3.10(XI) X2.1(OSC1)
XO: C21.2 R8.2 U3.9(XO) X2.3(OSC2)
$1N88: R2.1 U1.44(BOOT0)
$2N38: R7.1 U3.16(IREF)
$2N40: C19.1 U3.19(VDD_D)
$2N42: C17.2 C18.2 L3.1 U3.11(VDD_PA)
$2N43: L2.1 L3.2 U3.12(RFP)
$2N44: C15.1 L1.2
$2N45: L1.1 L2.2 U3.13(RFN)
$3N26: C39.2 R4.2
$3N28: R17.1 U6.5(KEY)
$3N30: L5.1 U6.7(SW)
$3N37: LED7.1(A) LED8.2(K) R16.2 U6.3(LED2)
$3N38: LED5.1(A) LED6.2(K) R15.2 U6.2(LED1)
$3N39: LED5.2(K) LED6.1(A) LED7.2(K) LED8.1(A) U6.4(LED3)
$4N2: C8.2 OLED1.2(C2P)
$4N3: C8.1 OLED1.3(C2N)
$4N4: C9.2 OLED1.4(C1P)
$4N5: C9.1 OLED1.5(C1N)
$4N16: OLED1.26(IREF) R3.2
$4N18: C10.2 OLED1.27(VCOMH)
$4N19: C11.2 OLED1.28(VCC)

Not connected (* = marked no-connect by the designer): OLED1 7(N.C)* 20(D2)*; SW1 1*; SW3 1*; SW7 3(EP)* 4(EP)*; SW8 3(EP)* 4(EP)*; U1 1(VBAT)* 2(PC13-TAMPER-RTC)* 3(PC14-OSC32_IN)* 4(PC15-OSC32_OUT)* 10(PA0-WKUP)* 29(PA8)* 32(PA11)* 33(PA12)* 45(PB8)* 46(PB9)*; U2 7* 8* 9* 10*; U4 7* 8* 9* 10*
